# Altium schematic sheet 25_Radar_PMIC_and_rail_filters.SchDoc
size 289 x 396 mm
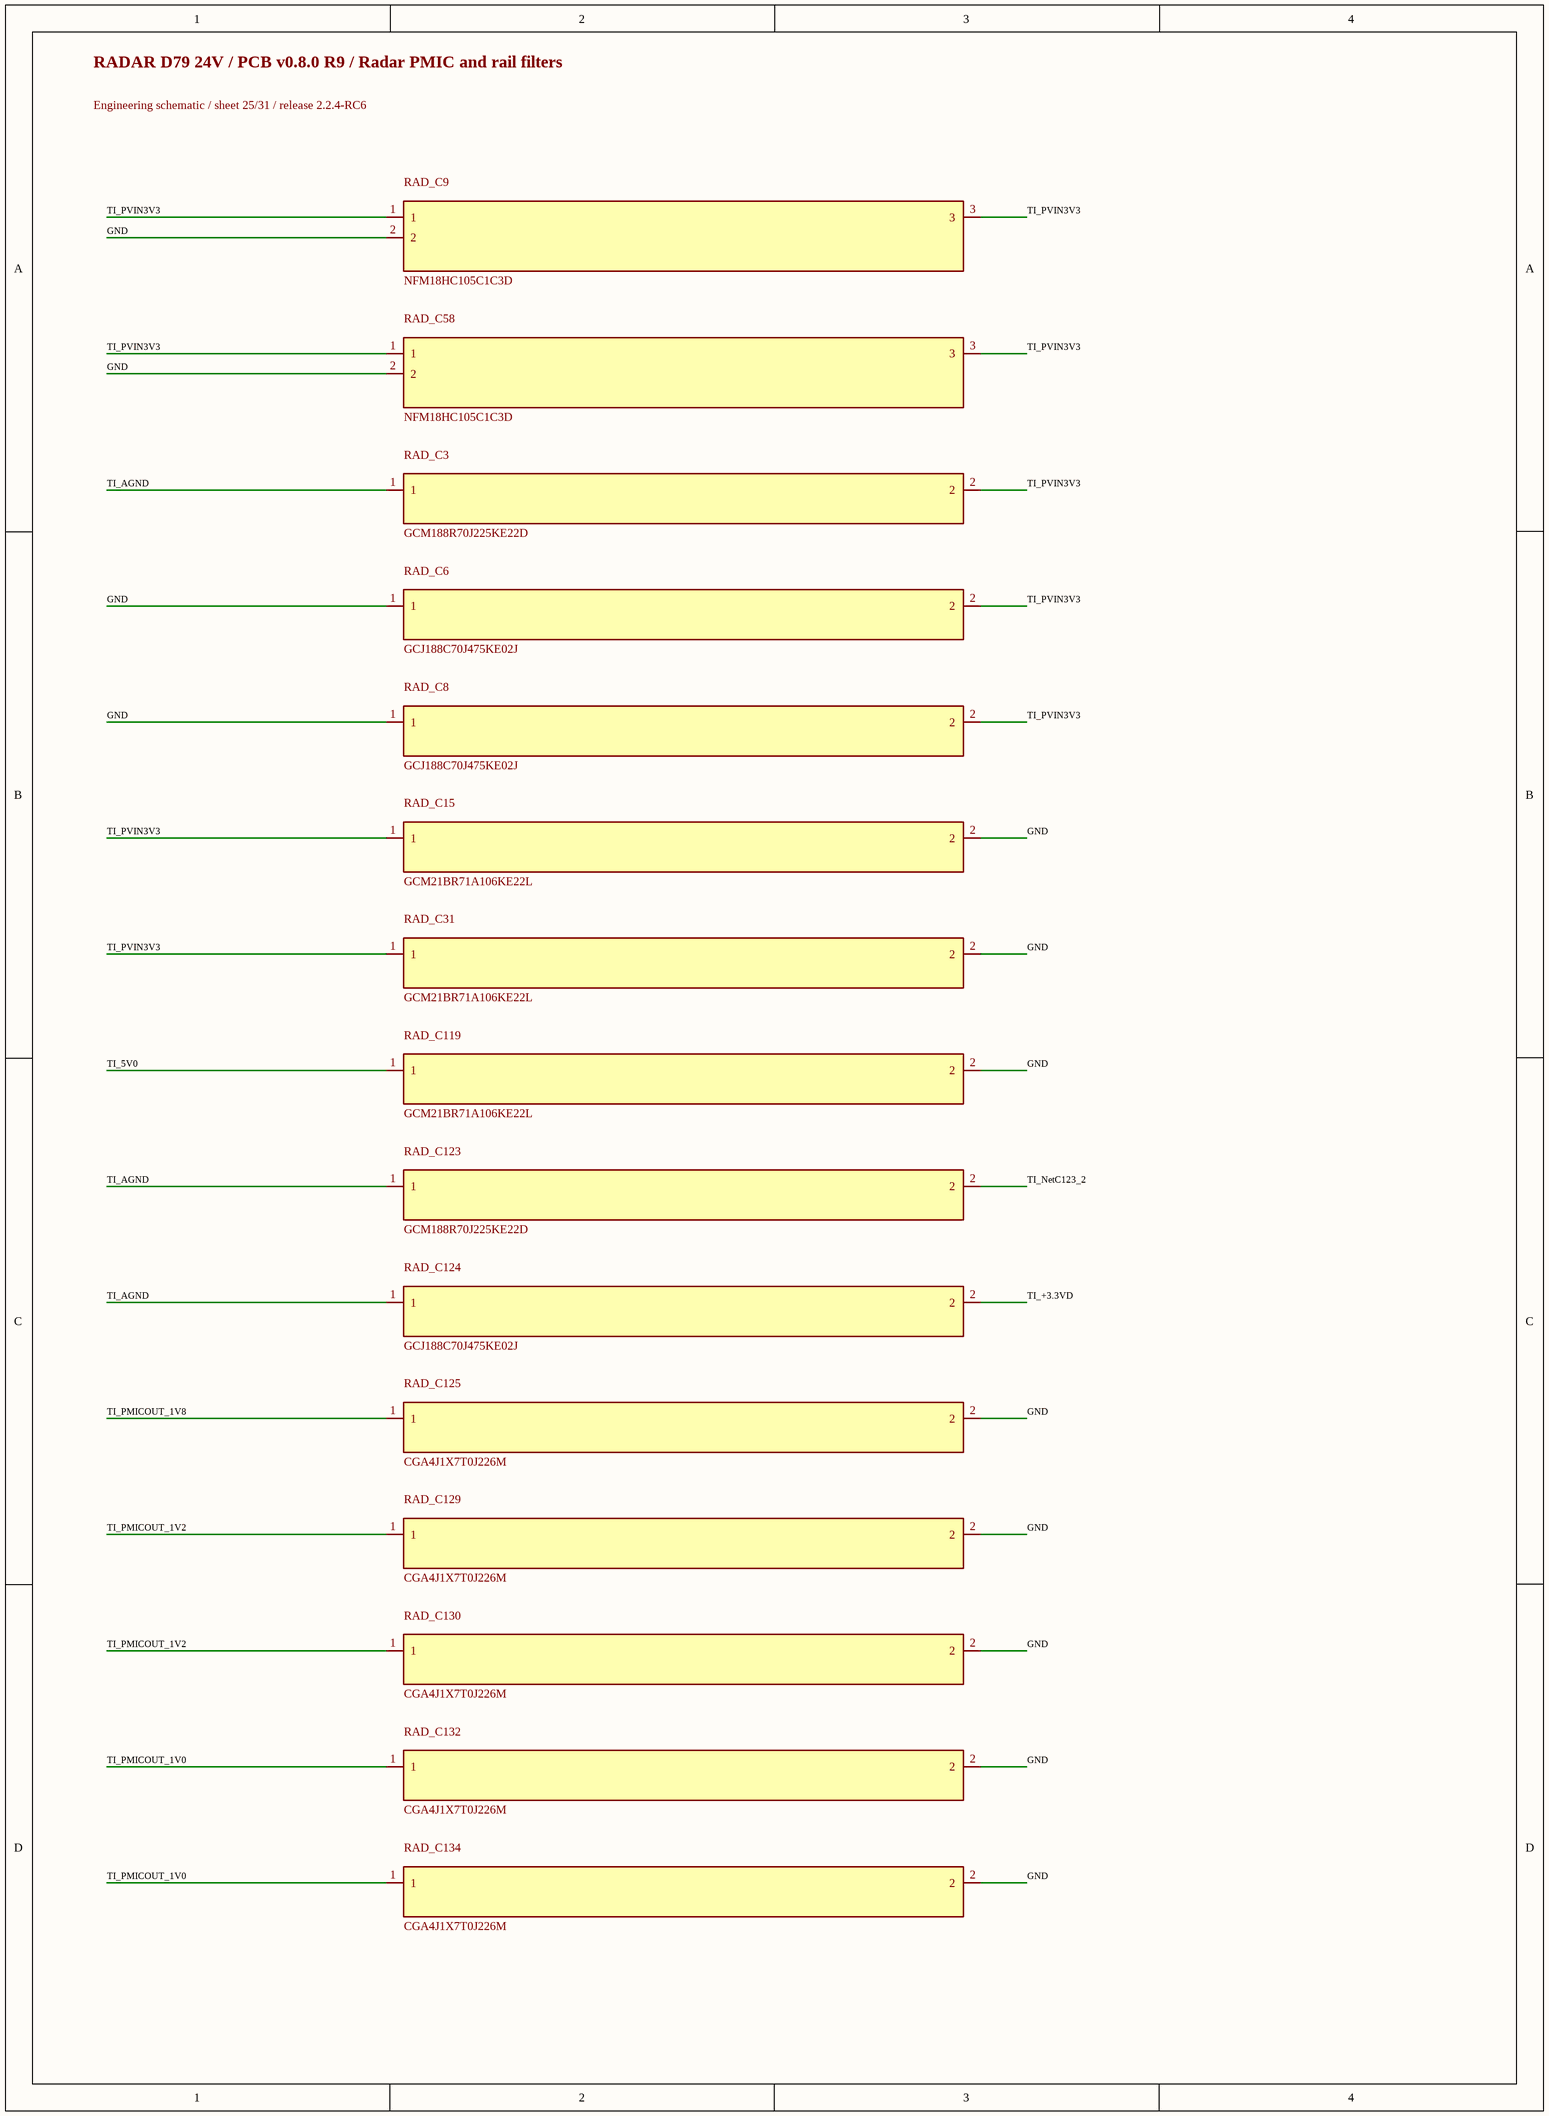
[diagram p0: 25_Radar_PMIC_and_rail_filters.SchDoc]

## Parts
RAD_C3  GCM188R70J225KE22D  [0603L]
RAD_C6  GCJ188C70J475KE02J  [FP-GCJ188C70J475KE02J_0603-MFG]
RAD_C8  GCJ188C70J475KE02J  [FP-GCJ188C70J475KE02J_0603-MFG]
RAD_C9  NFM18HC105C1C3D  [FP-NFM18HC105C1C3D_0603-MFG]
RAD_C15  GCM21BR71A106KE22L  [0805L]
RAD_C31  GCM21BR71A106KE22L  [0805L]
RAD_C58  NFM18HC105C1C3D  [FP-NFM18HC105C1C3D_0603-MFG]
RAD_C119  GCM21BR71A106KE22L  [0805L]
RAD_C123  GCM188R70J225KE22D  [0603L]
RAD_C124  GCJ188C70J475KE02J  [FP-GCJ188C70J475KE02J_0603-MFG]
RAD_C125  CGA4J1X7T0J226M  [0805_155]
RAD_C129  CGA4J1X7T0J226M  [0805_155]
RAD_C130  CGA4J1X7T0J226M  [0805_155]
RAD_C132  CGA4J1X7T0J226M  [0805_155]
RAD_C134  CGA4J1X7T0J226M  [0805_155]

## Nets
GND: RAD_C6.1 RAD_C8.1 RAD_C9.2 RAD_C15.2 RAD_C31.2 RAD_C58.2 RAD_C119.2 RAD_C125.2 RAD_C129.2 RAD_C130.2 RAD_C132.2 RAD_C134.2
TI_5V0: RAD_C119.1
TI_+3.3VD: RAD_C124.2
TI_AGND: RAD_C3.1 RAD_C123.1 RAD_C124.1
TI_NetC123_2: RAD_C123.2
TI_PMICOUT_1V0: RAD_C132.1 RAD_C134.1
TI_PMICOUT_1V2: RAD_C129.1 RAD_C130.1
TI_PMICOUT_1V8: RAD_C125.1
TI_PVIN3V3: RAD_C3.2 RAD_C6.2 RAD_C8.2 RAD_C9.1 RAD_C9.3 RAD_C15.1 RAD_C31.1 RAD_C58.1 RAD_C58.3

## Notes on the sheet
- RADAR D79 24V / PCB v0.8.0 R9 / Radar PMIC and rail filters
- Engineering schematic / sheet 25/31 / release 2.2.4-RC6